# Altium project ESP32-C3FH4.PrjPcb
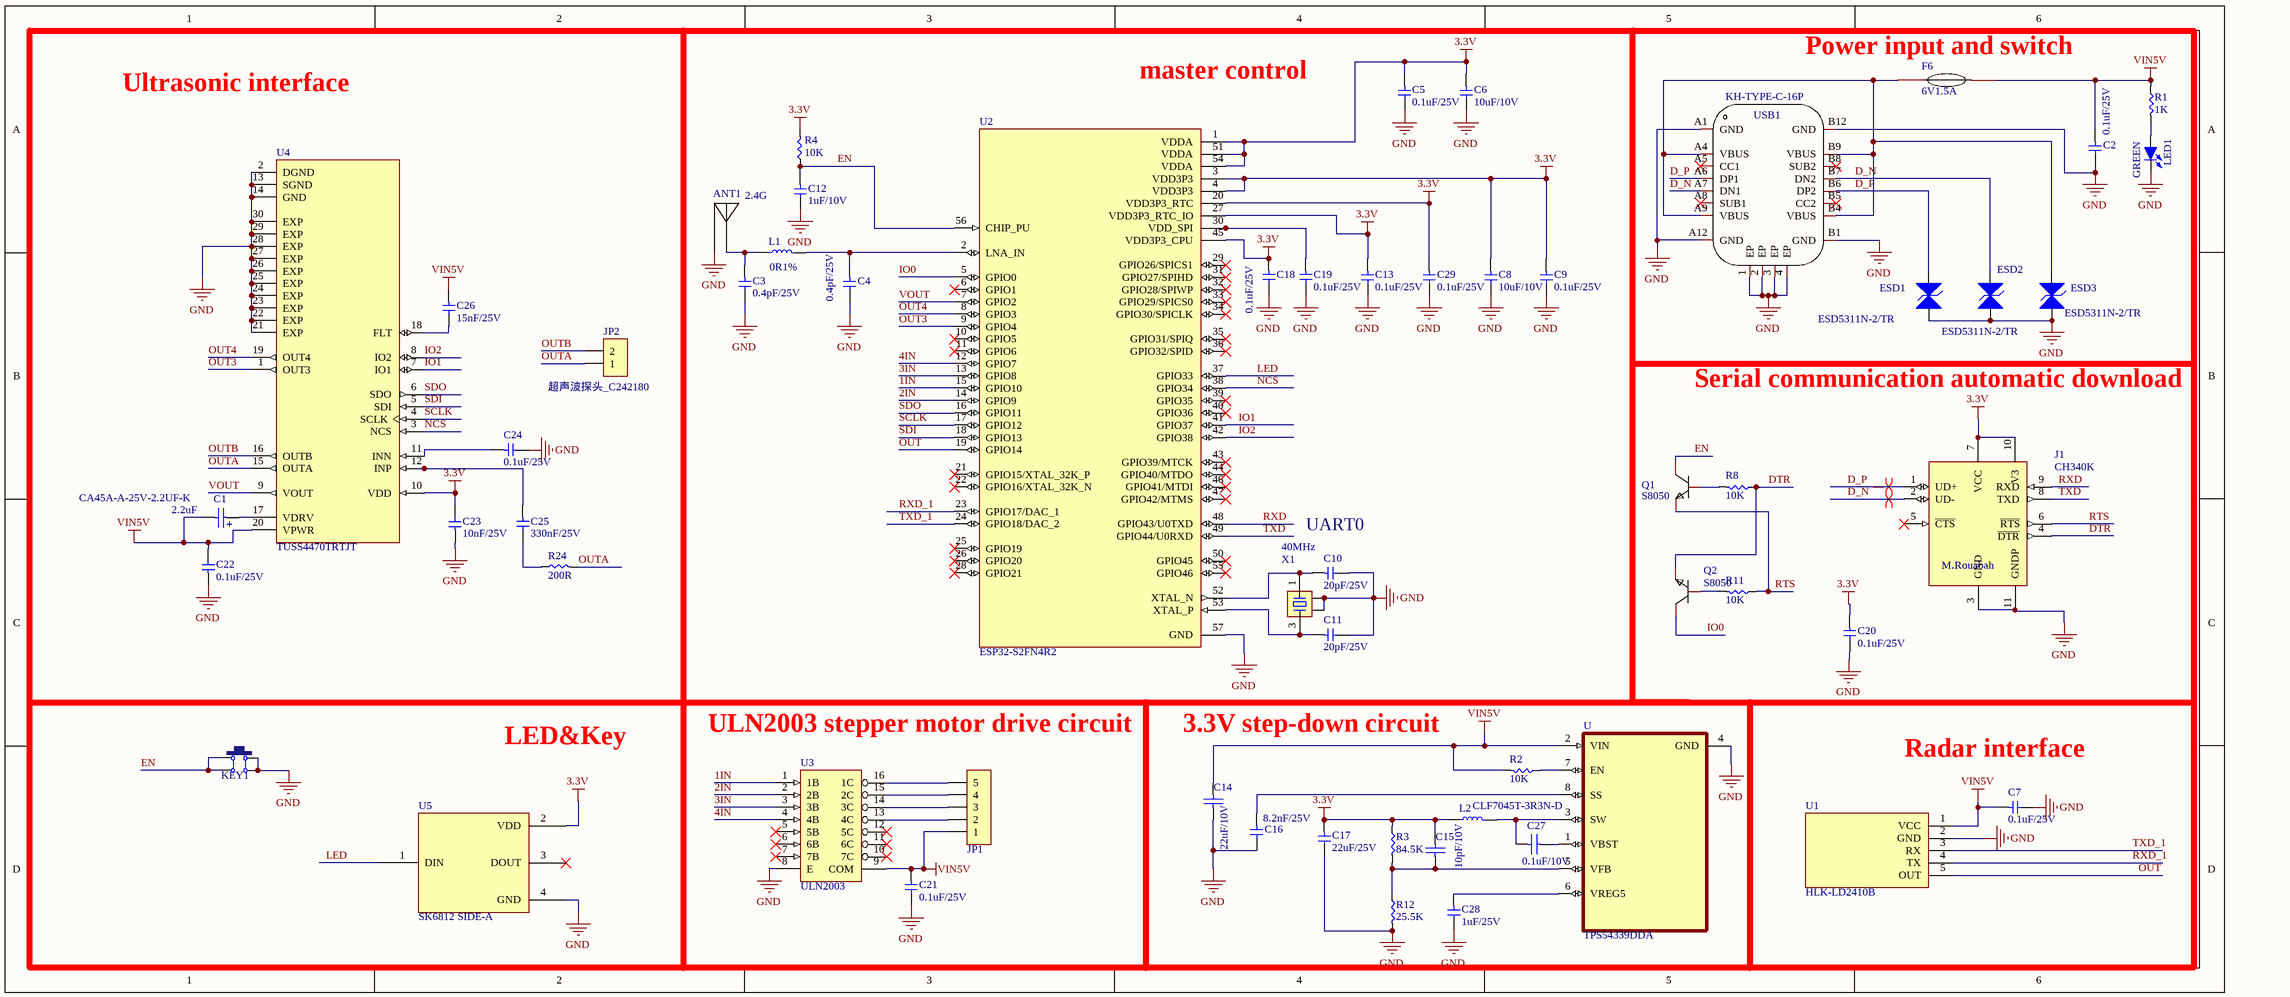
[diagram p0: ESP32-C3FH4.SchDoc]
1 sheet, 59 parts. Net scope: global (net labels, ports and power ports of the same name join across sheets).
Board file: ESP32-C3FH4.PcbDoc

## Sheet ESP32-C3FH4.SchDoc
size 457 x 203 mm

### Parts
ANT1  2.4G  [2.4GÌìÏß]
C1  CA45A-A-25V-2.2UF-K  value 2.2uF  [INDC3216]
C2  0.1uF/25V  [C 0402_L]
C3  0.4pF/25V  [C 0402_L]
C4  0.4pF/25V  [C 0402_L]
C5  0.1uF/25V  [C 0402_L]
C6  10uF/10V  [C 0402_L]
C7  0.1uF/25V  [C 0402_L]
C8  10uF/10V  [C 0402_L]
C9  0.1uF/25V  [C 0402_L]
C10  20pF/25V  [C 0402_L]
C11  20pF/25V  [C 0402_L]
C12  1uF/10V  [C 0402_L]
C13  0.1uF/25V  [C 0402_L]
C14  22uF/10V  [C 0402_L]
C15  10pF/10V  [C 0402_L]
C16  8.2nF/25V  [C 0402_L]
C17  22uF/25V  [C0805]
C18  0.1uF/25V  [C 0402_L]
C19  0.1uF/25V  [C 0402_L]
C20  0.1uF/25V  [C 0402_L]
C21  0.1uF/25V  [C 0402_L]
C22  0.1uF/25V  [C 0402_L]
C23  10nF/25V  [C 0402_L]
C24  0.1uF/25V  [C 0402_L]
C25  330nF/25V  [C 0402_L]
C26  15nF/25V  [C 0402_L]
C27  0.1uF/10V  [C 0402_L]
C28  1uF/25V  [C 0402_L]
C29  0.1uF/25V  [C 0402_L]
ESD1  ESD5311N-2/TR  [X1-DFN1006-2_L1.0-W0.6-RD]
ESD2  ESD5311N-2/TR  [X1-DFN1006-2_L1.0-W0.6-RD]
ESD3  ESD5311N-2/TR  [X1-DFN1006-2_L1.0-W0.6-RD]
F6  Name: 6V1.5A  [R 0805_L]  (hidden comment: 6V1A)
J1  CH340K  [*SOP100P600X160-11N]
JP1  HDR-1X5  [XH2.54-LI-5P]  (value not drawn)
JP2  超声波探头_C242180  [SENSOR-TH_GU12XXC-40XX]
KEY1  6*6*5  [TSW SMD-6*6*5]  (value not drawn)
L1  0R1%  [R 0402_L]
L2  CLF7045T-3R3N-D  [IND_CLF7045T-3R3N-D]
LED1  GREEN  [LED 0603B]
Q1  S8050  [SOT23-3L]
Q2  S8050  [SOT23-3L]
R1  1K  [R 0402_L]
R2  10K  [R 0402_L]
R3  84.5K  [R 0402_L]
R4  10K  [R 0402_L]
R8  10K  [R 0402_L]
R11  10K  [R 0402_L]
R12  25.5K  [R 0402_L]
R24  200R  [R 0402_L]
U  TPS54339DDA  [VREG_LM5017MR/NOPB]
U1  HLK-LD2410B  [HDR-TH_5P-P1.27-V-M]
U2  ESP32-S2FN4R2  [QFN40P700X700X90-57N]
U3  ULN2003  [SOP16]
U4  TUSS4470TRTJT  [QFN50P400X400X80-21N]
U5  SK6812 SIDE-A  [SK6812 SIDE-A]
USB1  C709357  [USB-C-SMD_KH-TYPE-C-16P]  (value not drawn)
X1  40MHz  [OSC 2016-4P]

### Nets
3.3V: C5.1 C6.1 C8.1 C9.1 C13.1 C15.2 C17.1 C18.1 C20.1 C23.2 C29.1 J1.7(VCC) J1.10(V3) L2.1 R3.1 R4.2 U2.1(VDDA) U2.3(VDD3P3) U2.4(VDD3P3) U2.20(VDD3P3_RTC) U2.27(VDD3P3_RTC_IO) U2.45(VDD3P3_CPU) U2.51(VDDA) U2.54(VDDA) U4.10(VDD) U5.2(VDD)
GND: ANT1.2 C2.2 C3.2 C4.2 C5.2 C6.2 C7.2 C8.2 C9.2 C10.2 C11.2 C12.2 C13.2 C14.1 C16.2 C17.2 C18.2 C19.2 C20.2 C21.2 C22.1 C23.1 C24.2 C28.2 C29.2 ESD1.1(K1) ESD2.1(K1) ESD3.1(K1) J1.3(GND) J1.11(GNDP) KEY1.1 KEY1.4 LED1.2(K) R12.2 U.4(GND) U1.2(GND) U2.57(GND) U3.8(E) U4.2(DGND) U4.13(SGND) U4.14(GND) U4.21(EXP) U4.22(EXP) U4.23(EXP) U4.24(EXP) U4.25(EXP) U4.26(EXP) U4.27(EXP) U4.28(EXP) U4.29(EXP) U4.30(EXP) U5.4(GND) USB1.1(EP) USB1.2(EP) USB1.3(EP) USB1.4(EP) USB1.A1(GND) USB1.A12(GND) USB1.B1(GND) USB1.B12(GND) X1.2 X1.4
VIN5V: C1.2 C2.1 C7.1 C14.2 C21.1 C22.2 C26.1 F6.1 JP1.1 R1.1 R2.2 U.2(VIN) U1.1(VCC) U3.9(COM) U4.20(VPWR)
1IN: U2.15(GPIO10) U3.1(1B)
2IN: U2.14(GPIO9) U3.2(2B)
3IN: U2.13(GPIO8) U3.3(3B)
4IN: U2.12(GPIO7) U3.4(4B)
D_N: ESD2.2(K2) J1.2(UD-) USB1.A7(DN1) USB1.B7(DN2)
D_P: ESD1.2(K2) J1.1(UD+) USB1.A6(DP1) USB1.B6(DP2)
DTR: J1.4(~{DTR}) Q2.2(E) R8.1
EN: C12.1 KEY1.2 KEY1.3 Q1.3(C) R4.1 U2.56(CHIP_PU)
IO0: Q2.3(C) U2.5(GPIO0)
IO1: U2.41(GPIO37) U4.7(IO1)
IO2: U2.42(GPIO38) U4.8(IO2)
LED: U2.37(GPIO33) U5.1(DIN)
NCS: U2.38(GPIO34) U4.3(NCS)
OUT: U1.5(OUT) U2.19(GPIO14)
OUT3: U2.9(GPIO4) U4.1(OUT3)
OUT4: U2.8(GPIO3) U4.19(OUT4)
OUTA: JP2.1 R24.2 U4.15(OUTA)
OUTB: JP2.2 U4.16(OUTB)
RTS: J1.6(~{RTS}) Q1.2(E) R11.1
RXD: J1.9(RXD) U2.48(GPIO43/U0TXD)
RXD_1: U1.4(TX) U2.23(GPIO17/DAC_1)
SCLK: U2.17(GPIO12) U4.4(SCLK)
SDI: U2.18(GPIO13) U4.5(SDI)
SDO: U2.16(GPIO11) U4.6(SDO)
TXD: J1.8(TXD) U2.49(GPIO44/U0RXD)
TXD_1: U1.3(RX) U2.24(GPIO18/DAC_2)
VOUT: U2.7(GPIO2) U4.9(VOUT)
NetANT1_1: ANT1.1 C3.1 L1.1
NetC1_1: C1.1 U4.17(VDRV)
NetC4_1: C4.1 L1.2 U2.2(LNA_IN)
NetC10_1: C10.1 U2.52(XTAL_N) X1.1
NetC11_1: C11.1 U2.53(XTAL_P) X1.3
NetC15_1: C15.1 R3.2 R12.1 U.5(VFB)
NetC16_1: C16.1 U.8(SS)
NetC19_1: C19.1 U2.30(VDD_SPI)
NetC24_1: C24.1 U4.11(INN)
NetC25_1: C25.1 U4.12(INP)
NetC25_2: C25.2 R24.1
NetC26_2: C26.2 U4.18(FLT)
NetC27_1: C27.1 U.1(VBST)
NetC27_2: C27.2 L2.2 U.3(SW)
NetC28_1: C28.1 U.6(VREG5)
NetESD3_2: ESD3.2(K2) F6.2 USB1.A4(VBUS) USB1.A9(VBUS) USB1.B4(VBUS) USB1.B9(VBUS)
NetJP1_2: JP1.2 U3.13(4C)
NetJP1_3: JP1.3 U3.14(3C)
NetJP1_4: JP1.4 U3.15(2C)
NetJP1_5: JP1.5 U3.16(1C)
NetLED1_1: LED1.1(A) R1.2
NetQ1_1: Q1.1(B) R8.2
NetQ2_1: Q2.1(B) R11.2
NetR2_1: R2.1 U.7(EN)

Not connected (* = marked no-connect by the designer): J1 5(~{CTS})*; U2 6(GPIO1)* 10(GPIO5)* 11(GPIO6)* 21(GPIO15/XTAL_32K_P)* 22(GPIO16/XTAL_32K_N)* 25(GPIO19)* 26(GPIO20)* 28(GPIO21)* 29(GPIO26/SPICS1)* 31(GPIO27/SPIHD)* 32(GPIO28/SPIWP)* 33(GPIO29/SPICS0)* 34(GPIO30/SPICLK)* 35(GPIO31/SPIQ)* 36(GPIO32/SPID)* 39(GPIO35)* 40(GPIO36)* 43(GPIO39/MTCK)* 44(GPIO40/MTDO)* 46(GPIO41/MTDI)* 47(GPIO42/MTMS)* 50(GPIO45)* 55(GPIO46)*; U3 5(5B)* 6(6B)* 7(7B)* 10(7C)* 11(6C)* 12(5C)*; U5 3(DOUT)*; USB1 A5(CC1)* A8(SUB1)* B5(CC2)* B8(SUB2)*

### Layout directives
differential pair: D_N, D_P

### Notes on the sheet
- master control
- (near F6) Power input and switch
- Ultrasonic interface
- Serial communication automatic download
- (near C10) UART0
- LED&Key
- ULN2003 stepper motor drive circuit
- 3.3V step-down circuit
- Radar interface
- (in symbol CH340K) M.Rouabah

### Library data of the parts
ANT1 = ANT1: PCB板载天线; 版权归属: 源创客; BOM名称: PCB板载天线; 学习资源: www.ooocke.com
C1 = Cap Pol2: Polarized Capacitor (Axial); Published: 8-Jun-2000; LatestRevisionDate: 17-Jul-2002; LatestRevisionNote: Re-released for DXP Platform.; PackageReference: POLAR0.8; Publisher: Altium Limited; PackageDescription: Polarized Capacitor; 2 Leads
C2-C13 C16-C26 C28 C29 = C
C14 C15 C27 = Cap: Capacitor; Manufacturer: Generic Components; Class: Passive; Value: 15P; Published: 08/06/2000; Publisher: Altium Hobart Technology Centre; SubClass: Capacitor
ESD1-ESD3 = tvs管
F6 = JK-SMD0603-100L: Manufacturer: Jinrui Electronic Materials Co.; Convert to PCB: yes; Origin Footprint: F0603; Symbol: 6V1A; Device: JK-SMD0603-100L; Supplier: LCSC; Supplier Part: C516069; Manufacturer Part: JK-SMD0603-100L; JLCPCB Part Class: Extended Part; Add into BOM: yes
J1 = CH340K: USB to Serial Port Chip; MF: WCH; SnapEDA_Link: https://www.snapeda.com/parts/CH340K/WCH/view-part/?ref=snap; Package: Package; Value: *; MP: CH340K; Check_prices: https://www.snapeda.com/parts/CH340K/WCH/view-part/?ref=eda
JP1 = Header 5: 5P接插件; 版权归属: 源创客; BOM名称: 5P接插件; 学习资源: www.ooocke.com
JP2 = Header 2: 2P接插件; 版权归属: 源创客; BOM名称: 2P接插件; 学习资源: www.ooocke.com
KEY1 = TSW DIP-6x6: 直插6x6轻触开关; 版权归属: 源创客; BOM名称: 直插6x6轻触开关; 学习资源: www.ooocke.com
L1 = L: Code_IEC: 1005; Published: 8-Jun-2000; LatestRevisionDate: 29-May-2009; LatestRevisionNote: IPC-7351 Footprint Added.; PackageReference: 0402-A; Publisher: Altium Limited; PackageDescription: Chip Inductor; Code_JEITA: 0402; Value: 0R1%
L2 = L: Code_IEC: 1005; Value: 0R1%; Published: 8-Jun-2000; LatestRevisionDate: 29-May-2009; LatestRevisionNote: IPC-7351 Footprint Added.; PackageReference: 0402-A; Publisher: Altium Limited; PackageDescription: Chip Inductor; Code_JEITA: 0402
LED1 = LED-SH-5MM: 5mm草帽LED; 版权归属: 源创客; BOM名称: 5mm草帽LED; 学习资源: www.ooocke.com
Q1 Q2 = S8050: Manufacturer: WPMtek(维攀微); Convert to PCB: yes; Origin Footprint: SOT-23-3_L2.9-W1.3-P1.90-LS2.4-BR; Name: S8050; Symbol: S8050; Device: S8050; Supplier: LCSC; Supplier Part: C2688231; Manufacturer Part: S8050; Add into BOM: yes
R1-R4 R8 R11 R12 R24 = Res
U = TPS54339EDDA: 4.5V to 23V Input, 3A Synchronous Step-Down Converter with D-CAP2 Mode and Light Load Efficiency 8-SO PowerPAD -40 to 85; MF: Texas Instruments; MP: TPS54339EDDA; Value: *; Package: HSOIC-8 Texas Instruments; Price: None; Availability: Unavailable; SnapEDA_Link: https://www.snapeda.com/parts/TPS54339EDDA/Texas%20Instruments/view-part/1156774/?ref=snap
U2 = ESP32-S2FN4R2: RF System on a Chip - SoC SMD Wi-Fi IC ESP32-S2FN4R2, single-core MCU, 4 MB flash and 2 MB PSRAM inside, QFN 56-pin, 7*7 mm; MF: Espressif Systems; SnapEDA_Link: https://www.snapeda.com/parts/ESP32-S2FN4R2/Espressif+Systems/view-part/?ref=snap; Package: QFN-56 Espressif Systems; Value: *; MP: ESP32-S2FN4R2; Check_prices: https://www.snapeda.com/parts/ESP32-S2FN4R2/Espressif+Systems/view-part/?ref=eda
U3 = ULN2003-2: 达林顿驱动芯片; 版权归属: 源创客; BOM名称: 达林顿驱动芯片; 学习资源: www.ooocke.com
U4 = TUSS4470TRTJT: ULTRASONIC SENSOR I/F FOR PARK A; Package: None; Price: None; Value: *; MP: TUSS4470TRTJT; Availability: Unavailable
U5 = SK6812 SIDE-A: INTEGRATED LIGHT SOURCE INTELLIGENT CONTROL OF / CHIP-ON-TOP SMD TYPE LED
USB1 = KH-TYPE-C-16P: Manufacturer: Shenzhen Kinghelm Elec; Convert to PCB: yes; Name: KH-TYPE-C-16P; Symbol: KH-TYPE-C-16P; Device: KH-TYPE-C-16P; Supplier: LCSC; Supplier Part: C709357; Manufacturer Part: KH-TYPE-C-16P; Add into BOM: yes; Origin Footprint: USB-C-SMD_KH-TYPE-C-16P
X1 = XTAL-MC-4P: MC系列4脚晶振; BOM名称: 2脚无源脚晶振; 版权归属: 源创客; 学习资源: www.ooocke.com